# Altium schematic sheet actuator-driver.SchDoc
size A4; SheetNumber: 1; SheetTotal: 6
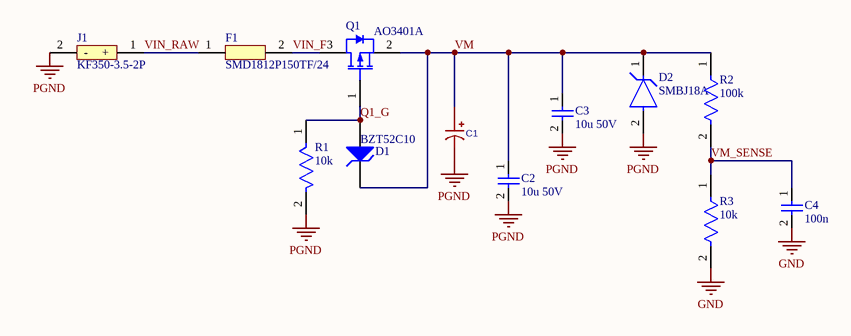
[diagram p0: actuator-driver.SchDoc]

## Parts
C1  RVT47UF50V67RV0029  [CAP_ELEC_6.3x7.7]  (value not drawn)
C2  10u 50V  [CAP_1206]
C3  10u 50V  [CAP_1206]
C4  100n  [RES_0603]
D1  BZT52C10  [SOD-123_MDD]
D2  SMBJ18A  [FP-SMBJ-MFG]
F1  SMD1812P150TF/24  [PTC_1812_RUILON]
J1  KF350-3.5-2P  [TERM_KF350_2P]
Q1  AO3401A  [AO-SOT-23-3L_V]
R1  10k  [RES_0603]
R2  100k  [RES_0603]
R3  10k  [RES_0603]

## Nets
GND: C4.2 R3.2
PGND: C1.2(-) C2.2 C3.2 D2.2(A) J1.2(-) R1.2
Q1_G: D1.1(A) Q1.1(GATE) R1.1
VIN_F: F1.2 Q1.3(DRAIN)
VIN_RAW: F1.1 J1.1(+)
VM: C1.1(+) C2.1 C3.1 D1.2(K) D2.1(C) Q1.2(SOURCE) R2.1
VM_SENSE: C4.1 R2.2 R3.1

## Library data of the parts
C1 = RVT47UF50V67RV0029: 47 uF 50 V aluminium electrolytic, 6.3x7.7; Manufacturer: KNSCHA(科尼盛); AddInBom: yes; ModelId: d5dd8793587942c3ae18823ce868290a; ModelName: CAP-SMD_BD6.3-L6.6-W6.6-H7.7; ModelTransform: 275.59,259.842,0,0,0,0,0,0,0; Value: 47uF; Tolerance: ±20%; Voltage Rating: 50V; Ripple Current: 70mA@120Hz; Lifetime: 2000hrs@105℃; Polarity type: Polarized; Symbol: RVT47UF50V67RV0029; LCSC Part Name: 47uF ±20% 50V; SupplierPart: C2887275; ManufacturerPart: RVT47UF50V67RV0029; Supplier Footprint: SMD,D6.3xL7.7mm; JLCPCB Part Class: Extended Part; Datasheet: https://item.szlcsc.com/datasheet/RVT47UF50V67RV0029/3103843.html; Supplier: LCSC; ConvertToPcb: yes; FootprintName: CAP-SMD_BD6.3-L6.6-W6.6-LS7.6-FD; Equivalent Series Resistance(ESR): -; Diameter: 6.3mm; Height - Seated (Max): 7.7mm; Operating Temperature: -55℃~+105℃
C2 C3 = CAP_1206: Capacitor, 1206; Value: 10u 50V
C4 = CAP_0603: Capacitor, 0603; Value: 100n
D1 = BZT52C10: Surface Mount Zener Diode, 10 V, SOD-123; Manufacturer: Changjing (CJ); LCSC: C2103
D2 = SMBJ18A: TVS DIODE 18V 29.2V DO214AA; Manufacturer: RUILON; Number Of Channels: 1; Max Junction Temp: +150°C; Breakdown Voltage: 20V; Peak Pulse Power: 600W; Direction: Unidirectional; Peak Pulse Current: 20.6A; RoHS: TRUE; ComponentLink2Description: Datasheet; Device Class L1: Circuit Protection; Manufacturer Part Number: SMBJ18A; Clamping Voltage: 29.2V; Height: 2.61mm; Temperature Range Low: -65°C; Temperature: -65°C to +150°C; Lead Free: Yes; Category: Diode; Reverse Standoff Voltage: 18V; Octopart: https://octopart.com/smbj18a-littelfuse-35303; ComponentLink2URL: https://www.littelfuse.com/~/media/electronics/datasheets/tvs_diodes/littelfuse_tvs_diode_smbj_datasheet.pdf.pdf; Package: SMBJ; Device Class L2: TVS Diodes; Automotive: No; Mouser Description: TVS Diodes - Transient Voltage Suppressors 18Vr 600W 20.6A 5% UniDirectional; Temperature Range High: +150°C; Device Class L3: unset; Digikey Description: TVS DIODE 18V 29.2V DO214AA; LCSC: C10212
F1 = SMD1812P150TF/24: PTC resettable fuse, 24 V, 1.5 A hold, 1812
J1 = KF350-3.5-2P: Screw terminal 2P 3.5 mm, power in
Q1 = AO3401A: P-Channel MOSFET, 30 V, 4 A, -55 to 150 degC, 3-Pin SOT-23-3L, RoHS, Tape and Reel; Manufacturer: Alpha and Omega; Output Power (Max): NotRequiredW; Power Dissipation: 1.4W; Rad Hardened: No; Drain Efficiency: NotRequired%; Drain-Source On-Volt: 30V; Noise Figure: NotRequireddB; Frequency (Max): NotRequiredMHz; Number of  Elements: 1; Gate-Source Voltage (Max): ?12V; Drain Current (Max): 4A; Channel Mode: Enhancement; Drain-Source On-Res: 0.044ohm; Type: PowerMOSFET; Polarity: P; Package URL: http://www.aosmd.com/res/packaging_information/SOT-23-3L.pdf; Datasheet URL: http://www.aosmd.com/res/data_sheets/AO3401A.pdf; Package Type: SOT-23; Package Description: 3-Pin Small Outline Transistor, Body 2.95 x 1.6 mm, Pitch 0.95 mm; Mounting: SurfaceMount; Manufacturer URL: http://www.aosmd.com/; Continuous Drain Current: 4A; Package Reference: SOT-23-3L; Mounting Technology: SurfaceMount; Operating Temperature Classification: Military; Power Gain: NotRequireddB; Datasheet Version: Rev. 3, 03/2011; Operating Temp Range: -55Cto150C; Pin Count: 3
R1-R3 = RES_0603: Resistor, 0603
  R1 R3: Value: 10k
  R2: Value: 100k